# Altium schematic sheet Sheet7.SchDoc
size A; SheetNumber: 7; SheetTotal: 7
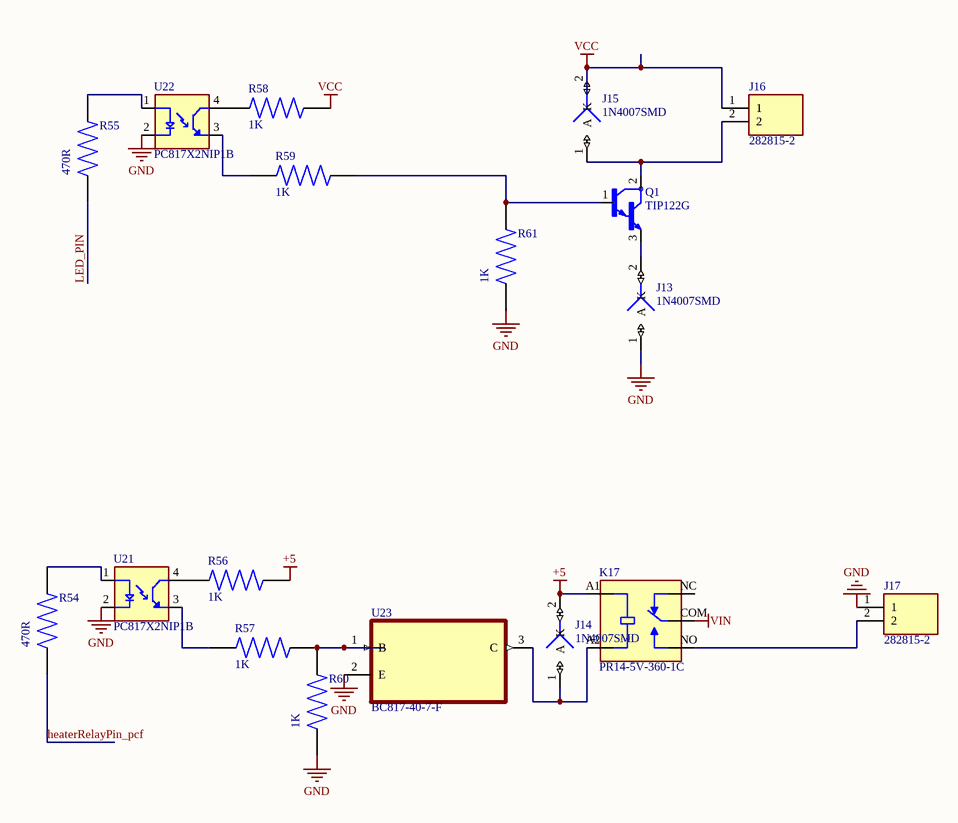
[diagram p0: Sheet7.SchDoc]

## Parts
J13  1N4007SMD  [C1206]
J14  1N4007SMD  [C1206]
J15  1N4007SMD  [C1206]
J16  282815-2  [TE_282815-2]
J17  282815-2  [TE_282815-2]
K17  PR14-5V-360-1C  [RELAY_PR14-5V-360-1C]
Q1  TIP122G  [TO254P1009X445X1985-3]
R54  470R  [RESC2012X65N]
R55  470R  [RESC2012X65N]
R56  1K  [RESC2012X65N]
R57  1K  [RESC2012X65N]
R58  1K  [RESC2012X65N]
R59  1K  [RESC2012X65N]
R60  1K  [RESC2012X65N]
R61  1K  [RESC2012X65N]
U21  PC817X2NIP1B  [SOIC254P960X420-4N]
U22  PC817X2NIP1B  [SOIC254P960X420-4N]
U23  BC817-40-7-F  [SOT103P240X110-3N]

## Nets
+5: J14.2(K) K17.A1(COIL1) R56.2
GND: J13.1(A) J17.1 R60.1 R61.1 U21.2(C) U22.2(C) U23.2(E)
VCC: J15.2(K) J16.1 R58.2
VIN: K17.COM
heaterRelayPin_pcf: R54.1
LED_PIN: R55.1
NetJ13_2: J13.2(K) Q1.3(E)
NetJ14_1: J14.1(A) K17.A2(COIL2) U23.3(C)
NetJ15_1: J15.1(A) J16.2 Q1.2(C)
NetJ17_2: J17.2 K17.NO
NetQ1_1: Q1.1(B) R59.2 R61.2
NetR54_2: R54.2 U21.1(A)
NetR55_2: R55.2 U22.1(A)
NetR56_1: R56.1 U21.4(CT)
NetR57_1: R57.1 U21.3(ET)
NetR57_2: R57.2 R60.2 U23.1(B)
NetR58_1: R58.1 U22.4(CT)
NetR59_1: R59.1 U22.3(ET)

Not connected (* = marked no-connect by the designer): K17 NC

## Library data of the parts
J13-J15 = 1N4007SMD: RECTIFIER, 1KV, 1A, DO-214AC; Available until stocks are exhausted Alternatives available; MF: Multicomp Pro; Availability: Not in stock; Check_prices: https://www.snapeda.com/parts/1N4007SMD/Multicomp/view-part/?ref=eda; Package: None; SnapEDA_Link: https://www.snapeda.com/parts/1N4007SMD/Multicomp/view-part/?ref=snap; MP: 1N4007SMD; Price: None; Value: *
J16 J17 = 282815-2: 2 Position Terminal Block Header, Male Pins, Shrouded (2 Side) 0.200 (5.08mm) 90Â°, Right Angle - Through Hole; MF: TE Connectivity; SnapEDA_Link: https://www.snapeda.com/parts/282815-2/TE+Connectivity+AMP+Connectors/view-part/?ref=snap; Package: None; Value: *; MP: 282815-2; EU_RoHS_Compliance: Compliant with Exemptions; Check_prices: https://www.snapeda.com/parts/282815-2/TE+Connectivity+AMP+Connectors/view-part/?ref=eda
K17 = PR14-5V-360-1C: 19 x 15.5 x 15.8 mm, 5 V, 10 A, SPDT (1 Form C), Power Relay; MF: Same Sky; SnapEDA_Link: https://www.snapeda.com/parts/PR14-5V-360-1C/Same+Sky/view-part/?ref=snap; Package: None; Value: *; MP: PR14-5V-360-1C; Check_prices: https://www.snapeda.com/parts/PR14-5V-360-1C/Same+Sky/view-part/?ref=eda
Q1 = TIP122G: Bipolar (BJT) Transistor NPN - Darlington 100V 5A 2W Through Hole TO-220AB; MF: ON Semiconductor; Check_prices: https://www.snapeda.com/parts/TIP122G/ON%20Semiconductor/view-part/385313/?ref=eda; Price: None; SnapEDA_Link: https://www.snapeda.com/parts/TIP122G/ON%20Semiconductor/view-part/385313/?ref=snap; Package: None; Purchase-URL: https://pricing.snapeda.com/search/part/TIP122G/?ref=eda; Availability: Good; Value: *; MP: TIP122G
R54-R61 = RN73C2A3K3BTDF: TE; IND Devices; Resistors; RN 0805 3K3 0.1% 10PPM 1K RL | TE Connectivity RN73C2A3K3BTDF; Power_Rating: .1 W; Resistance: 3.3K; Voltage_Rating: 100 V; Tolerance: .1%; SnapEDA_Link: https://www.snapeda.com/parts/RN73C2A3K3BTDF/TE+Connectivity/view-part/?ref=snap; Package: 0805; Value: *; MF: TE Connectivity; MP: RN73C2A3K3BTDF; EU_RoHS_Compliance: Compliant; Check_prices: https://www.snapeda.com/parts/RN73C2A3K3BTDF/TE+Connectivity/view-part/?ref=eda
U21 U22 = PC817X2NIP1B: Optocoupler DC-IN 1-CH Transistor DC-OUT 4-Pin DIP SMD T/R; MF: Sharp Microelectronics; SnapEDA_Link: https://www.snapeda.com/parts/PC817X2NIP1B/Sharp+Microelectronics/view-part/?ref=snap; Package: SMD-4 Sharp Microelectronics; Value: *; MP: PC817X2NIP1B; Check_prices: https://www.snapeda.com/parts/PC817X2NIP1B/Sharp+Microelectronics/view-part/?ref=eda
U23 = BC817-40-7-F: Bipolar (BJT) Transistor NPN 45 V 500 mA 100MHz 310 mW Surface Mount SOT-23-3; MF: Diodes Inc.; MP: BC817-40-7-F; Price: None; Package: SOT-23 Diodes Inc.; Check_prices: https://www.snapeda.com/parts/BC817-40-7-F/Diodes+Inc./view-part/?ref=eda; Value: *; Availability: In Stock; Purchase-URL: https://pricing.snapeda.com/search/part/BC817-40-7-F/?ref=eda; SnapEDA_Link: https://www.snapeda.com/parts/BC817-40-7-F/Diodes+Inc./view-part/?ref=snap